# Altium schematic sheet Main.SchDoc
size A2
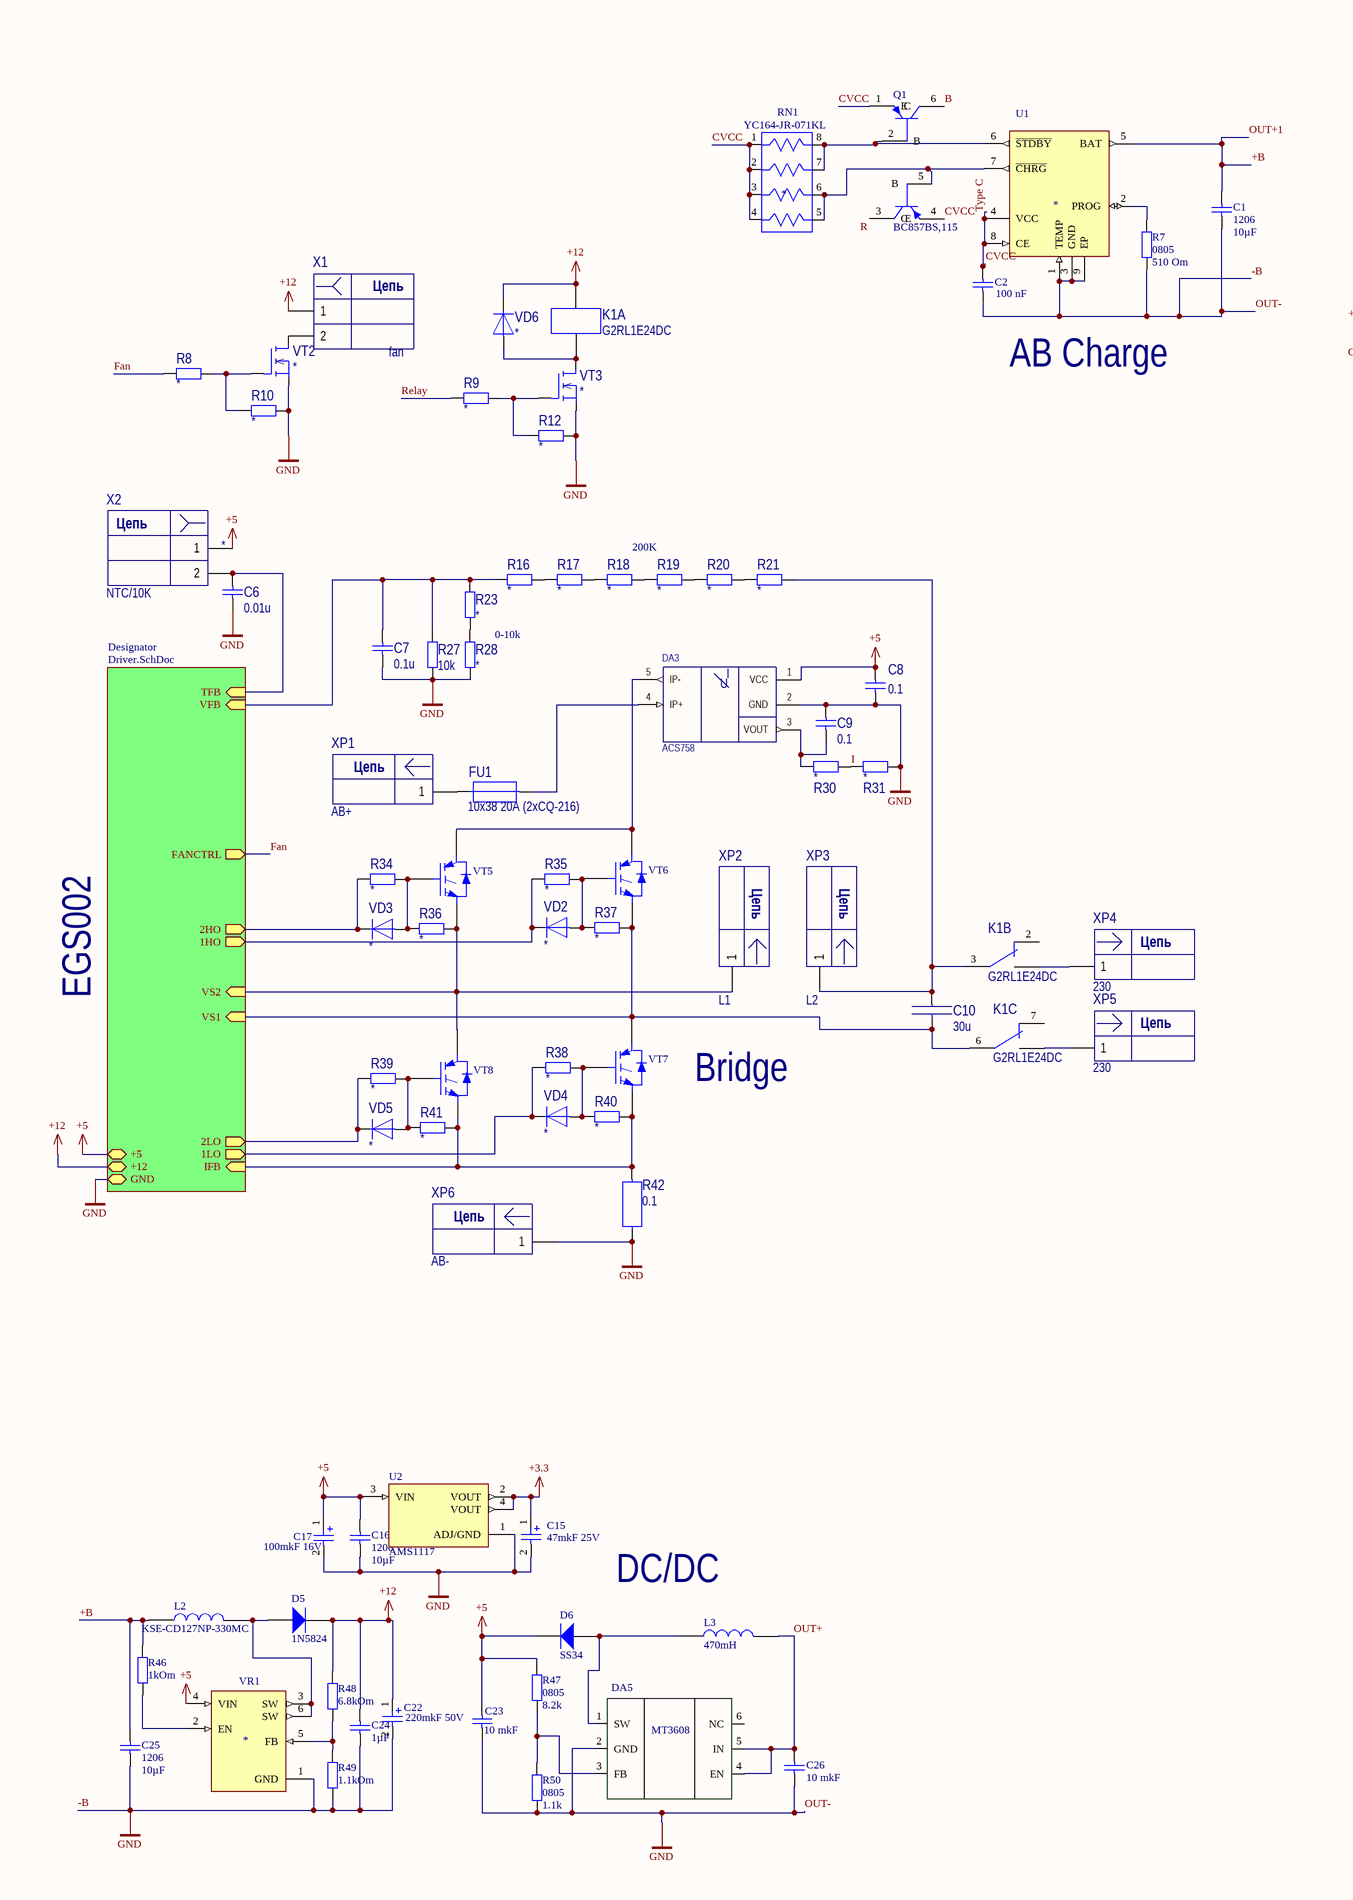
[diagram p0: Main.SchDoc, left]
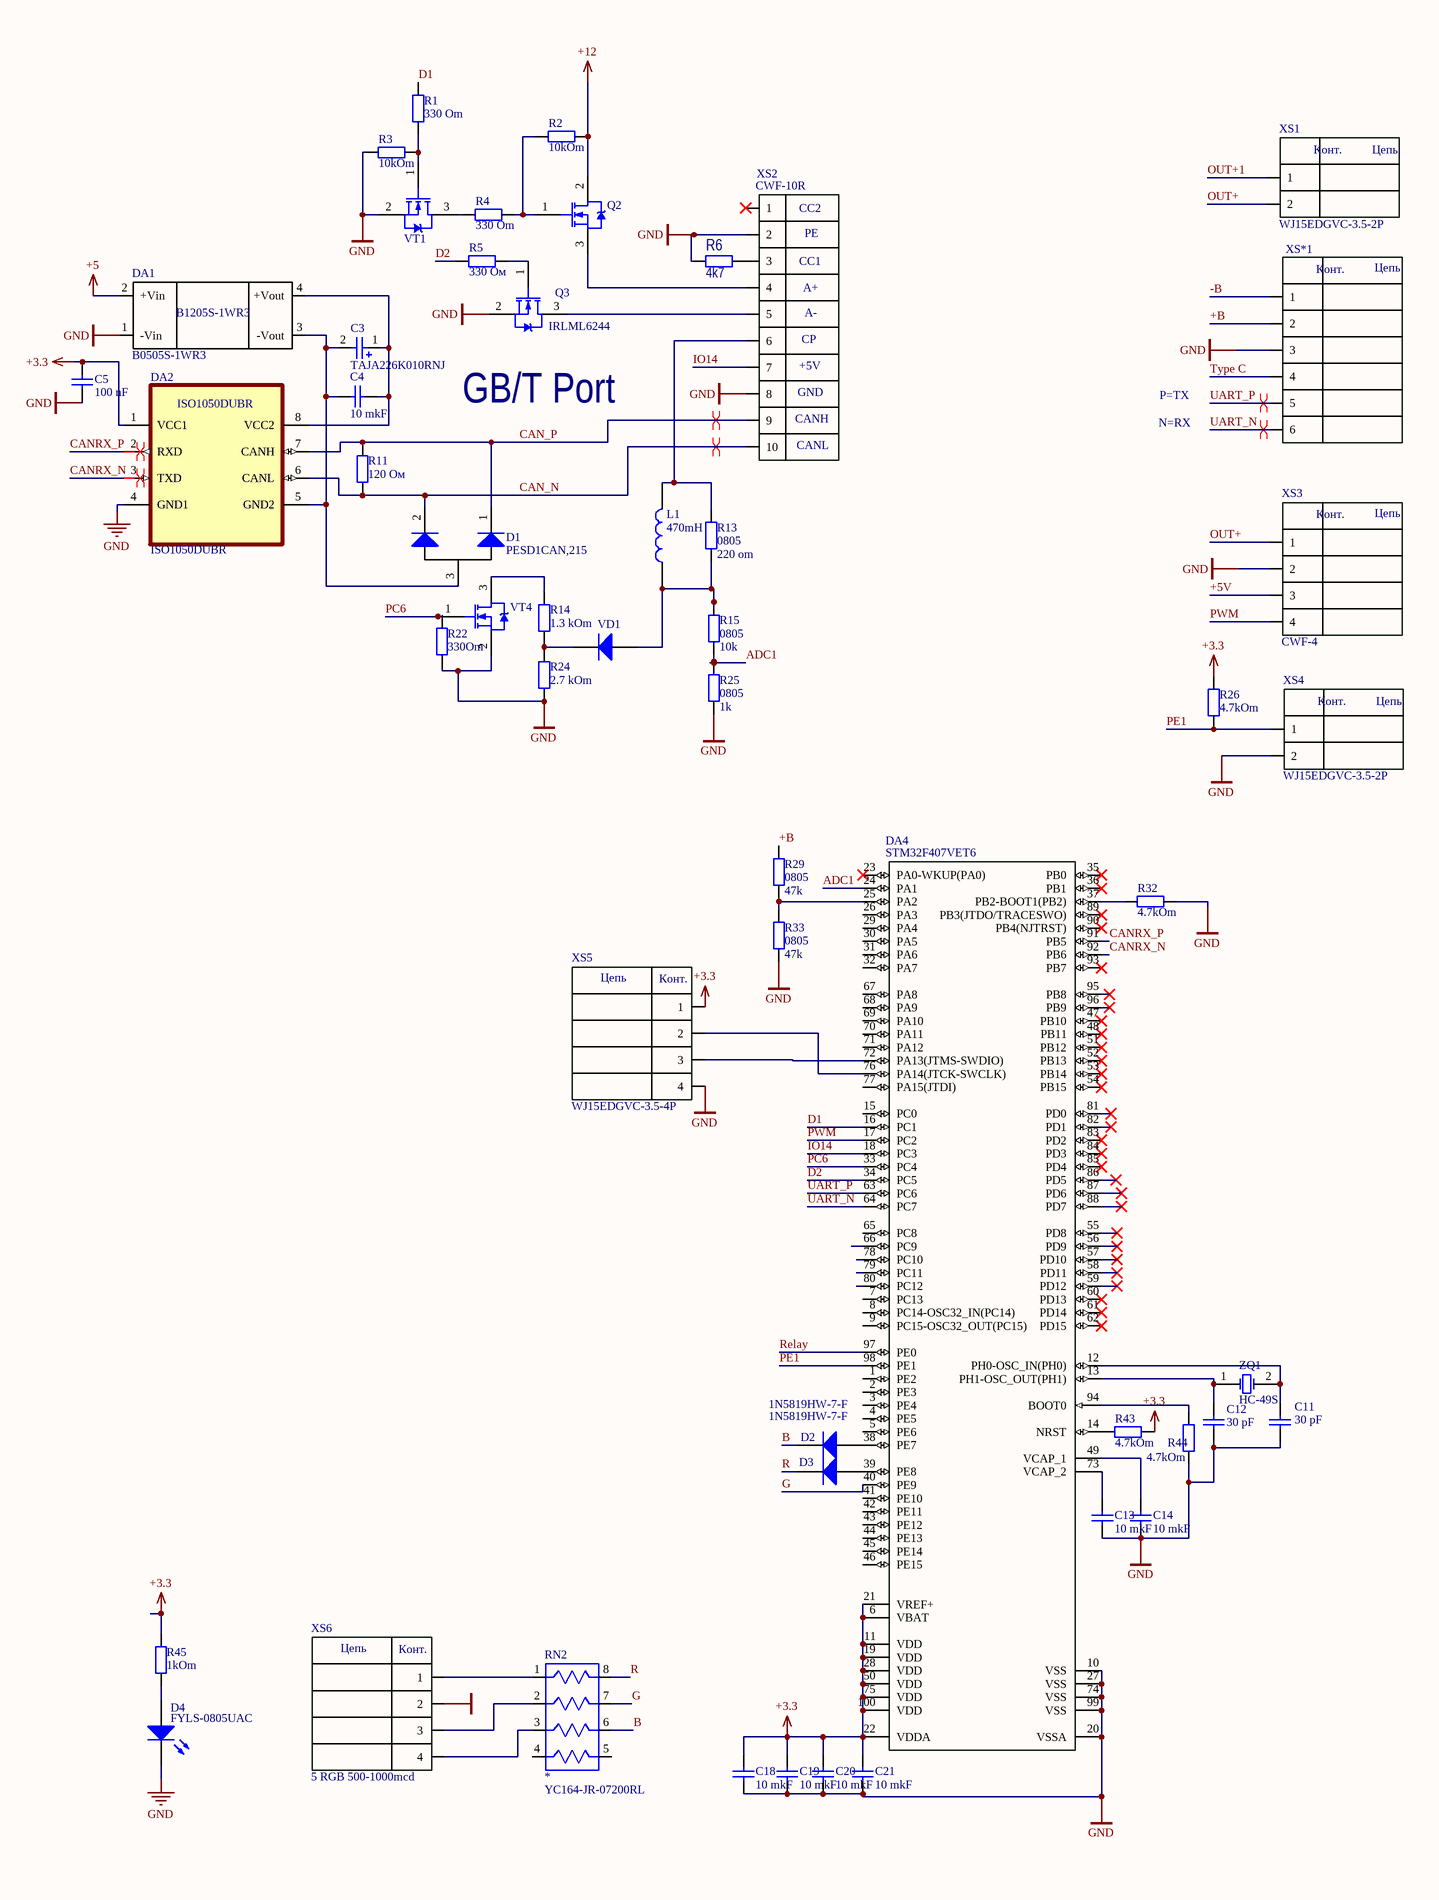
[diagram p1: Main.SchDoc, right]

## Parts
C1  1206  value 10µF  [1206C]
C2  100 nF  [0805_old]
C3  TAJA226K010RNJ  [SMDA Tantal Polar]
C4  10 mkF  [1206C]
C5  100 nF  [6-0805_L]
C6  0.01u  [3216[1206]]
C7  0.1u  [2012[0805]]
C8  0.1  [2012[0805]]
C9  0.1  [2012[0805]]
C10  30u  [B32776G]
C11  30 pF  [0805_old]
C12  30 pF  [0805_old]
C13  10 mkF  [1206C]
C14  10 mkF  [1206C]
C15  47mkF 25V  [SMDD Tantal Polar]
C16  1206  value 10µF  [1206C]
C17  100mkF 16V  [SMDD Tantal Polar]
C18  10 mkF  [1206C]
C19  10 mkF  [1206C]
C20  10 mkF  [1206C]
C21  10 mkF  [1206C]
C22  220mkF 50V  [ECAP 220 35V]
C23  10 mkF  [1206C]
C24  1µF  [1206C]
C25  1206  value 10µF  [1206C]
C26  10 mkF  [1206C]
D1  PESD1CAN,215  [SOT23_M]
D2  1N5819HW-7-F  [1206C Diode]
D3  1N5819HW-7-F  [1206C Diode]
D4  FYLS-0805UAC  [0805_3V3]
D5  1N5824  [*DO214_SS14(Primary) - duplicate]
D6  SS34  [*DO214_SS14(Primary) - duplicate]
DA1  B0505S-1WR3  [SIP4]
DA2  ISO1050DUBR  [ISO1050]
DA3  ACS758  [ACS758]
DA4  STM32F407VET6  [STM-LQFP100_M]
DA5  (no value)  [SOT23-6_L]
FU1  10x38 20A (2xCQ-216)  [Fuse 10x38]
K1  G2RL1E24DC  [G2RL1E24DC]  (parts A,B,C of 3)
L1  470mH  [LQH43CN471K]
L2  value KSE-CD127NP-330MC  [CDRH127/LDNP-680MC]  (hidden comment: AC1050)
L3  470mH  [MT3608 IND]
Q1  BC857BS,115  [SOT95P280X145-6N]
Q2  (no value)  [SOT23_N]
Q3  IRLML6244  [SOT23_N]
R1  330 Om  [6-0805_N]
R2  10kOm  [6-0805_N]
R3  10kOm  [6-0805_N]
R4  330 Om  [6-0805_N]
R5  330 Ом  [6-0805_N]
R6  4k7  [6-0805_L]
R7  0805  value 510 Om  [6-0805_N]
R8  *  [6-0805_L]
R9  *  [6-0805_L]
R10  *  [1005[0402]]
R11  120 Ом  [6-0805_N]
R12  *  [1005[0402]]
R13  0805  value 220 om  [6-0805_N]
R14  value 1.3 kOm  [6-0805_N]  (hidden comment: 0805)
R15  0805  value 10k  [6-0805_N]
R16  *  [3225[1210]]
R17  *  [3225[1210]]
R18  *  [3225[1210]]
R19  *  [3225[1210]]
R20  *  [3225[1210]]
R21  *  [3225[1210]]
R22  value 330Om  [6-0805_N]  (hidden comment: 0805)
R23  *  [3225[1210]]
R24  value 2.7 kOm  [6-0805_N]  (hidden comment: 0805)
R25  0805  value 1k  [6-0805_N]
R26  4.7kOm  [6-0805_N]
R27  10k  [6-0805_N]
R28  *  [3225[1210]]
R29  0805  value 47k  [6-0805_N]
R30  *  [2012[0805]]
R31  *  [2012[0805]]
R32  4.7kOm  [6-0805_N]
R33  0805  value 47k  [6-0805_N]
R34  *  [2012[0805]]
R35  *  [2012[0805]]
R36  *  [2012[0805]]
R37  *  [2012[0805]]
R38  *  [2012[0805]]
R39  *  [2012[0805]]
R40  *  [2012[0805]]
R41  *  [2012[0805]]
R42  0.1  [5W-0.1 draw]
R43  4.7kOm  [6-0805_N]
R44  4.7kOm  [6-0805_N]
R45  1kOm  [6-0805_N]
R46  value 1kOm  [6-0805_N]  (hidden comment: 0805)
R47  0805  value 8.2k  [6-0805_N]
R48  value 6.8kOm  [6-0805_N]  (hidden comment: 0805)
R49  value 1.1kOm  [6-0805_N]  (hidden comment: 0805)
R50  0805  value 1.1k  [6-0805_N]
RN1  *  value YC164-JR-071KL  [RESCAV80P320X160X70-8N]
RN2  *  value YC164-JR-07200RL  [RESCAV80P320X160X70-8N]
U1  *  [SOP127P600X175-9N]
U2  AMS1117  [SOT229P700X180-4N]
VD1  SK-24  [SMDA diode]  (value not drawn)
VD2  *  [SMDA diode]
VD3  *  [SMDA diode]
VD4  *  [SMDA diode]
VD5  *  [SMDA diode]
VD6  *  [SMDA diode]
VR1  *  [xl6009]
VT1  IRLM0040  [SOT23_N]  (value not drawn)
VT2  *  [DPAK229P990X239-3N]
VT3  *  [DPAK229P990X239-3N]
VT4  IRLM0040  [SOT23_N]  (value not drawn)
VT5  VT Transistor IGBT  [to247-hor]  (value not drawn)
VT6  VT Transistor IGBT  [to247-hor]  (value not drawn)
VT7  VT Transistor IGBT  [to247-hor]  (value not drawn)
VT8  VT Transistor IGBT  [to247-hor]  (value not drawn)
X1  fan  [CWF-2]
X2  NTC/10K  [CWF-2]
XP1  AB+  [K13 М4*9(DECA SwitchLab)]
XP2  L1  [K13 М4*9(DECA SwitchLab)]
XP3  L2  [K13 М4*9(DECA SwitchLab)]
XP4  230  [K13 М4*9(DECA SwitchLab)]
XP5  230  [K13 М4*9(DECA SwitchLab)]
XP6  AB-  [K13 М4*9(DECA SwitchLab)]
XS1  WJ15EDGVC-3.5-2P  [CWF-2]
XS2  CWF-10R  [CWF-10]
XS3  CWF-4  [CWF-4]
XS4  WJ15EDGVC-3.5-2P  [CWF-2]
XS5  WJ15EDGVC-3.5-4P  [PLS-4 - duplicate]
XS6  5 RGB 500-1000mcd  [5 RGB 500-1000mcd]
XS*1  *  [CWF-6]  (value not drawn)
ZQ1  HC-49S  [HC 49SM]

## Sub-sheets
Designator = Driver.SchDoc: IFB (in), 1LO (out), VS1 (in), 1HO (out), 2LO (out), GND, +12, +5, VS2 (in), 2HO (out), VFB (in), TFB (in), FANCTRL (out)

## Nets
+3.3: C5.1 C15.1 C18.1 C19.1 C20.1 C21.1 DA2.1(VCC1) DA4.6(VBAT) DA4.11(VDD) DA4.19(VDD) DA4.21(VREF+) DA4.22(VDDA) DA4.28(VDD) DA4.50(VDD) DA4.75(VDD) DA4.100(VDD) R26.2 R43.1 R45.2 U2.2(VOUT) U2.4(VOUT) XS5.1
+5: C8.1 C16.1 C17.1 C23.1 D6.2(K) DA1.2(+Vin) DA3.1(VCC) R47.2 U2.3(VIN) VR1.4(VIN) X2.1 ; sheet Designator/+5
+12: C22.1 C24.2 D5.2(K) K1.1 Q2.2(D) R2.2 R48.2 VD6.2(K) X1.1 ; sheet Designator/+12
-B: C1.2 C2.1 C5.2 C6.2 C7.2 C8.2 C9.1 C11.2 C12.2 C13.2 C14.2 C15.2 C16.2 C17.2 C18.2 C19.2 C20.2 C21.2 C22.2 C23.2 C24.1 C25.2 C26.2 D4.2(K) DA1.1(-Vin) DA2.4(GND1) DA3.2(GND) DA4.10(VSS) DA4.20(VSSA) DA4.27(VSS) DA4.74(VSS) DA4.99(VSS) DA5.2(GND) Q3.2(S) R3.1 R6.1 R7.1 R10.2 R12.2 R22.1 R24.1 R25.1 R27.1 R28.1 R31.1 R32.1 R33.1 R42.1 R44.1 R49.1 R50.1 U1.1(TEMP) U1.3(GND) U1.9(EP) U2.1(ADJ/GND) VR1.1(GND) VT1.2(S) VT2.3(S) VT3.3(S) VT4.2(S) XP6.1 XS2.2 XS2.8 XS3.2 XS4.2 XS5.4 XS6.2 XS*1.1 XS*1.3 ; sheet Designator/GND  [also labelled GND, OUT-]
+5V: XS3.3
+B: C1.1 C25.1 L2.1 R29.2 R46.2 U1.5(BAT) XS1.1 XS*1.2  [also labelled OUT+1]
ADC1: DA4.24(PA1) R15.1 R25.2
B: D2.2(K) Q1.6(C) RN2.6
CAN_N: D1.2(K) DA2.6(CANL) R11.1 XS2.10
CAN_P: D1.1(K) DA2.7(CANH) R11.2 XS2.9
CANRX_N: DA2.3(TXD) DA4.92(PB6)
CANRX_P: DA2.2(RXD) DA4.91(PB5)
CVCC: C2.2 Q1.1(E) Q1.4(E) RN1.1 RN1.2 RN1.3 RN1.4 U1.4(VCC) U1.8(CE) XS*1.4  [also labelled Type C]
D1: DA4.16(PC1) R1.2
D2: DA4.34(PC5) R5.1
Fan: R8.1 ; sheet Designator/FANCTRL
G: DA4.40(PE9) RN2.7
I: R30.1 R31.2
IO14: DA4.18(PC3) XS2.7
OUT+: C26.1 DA5.4(EN) DA5.5(IN) L3.2 XS1.2 XS3.1
PC6: DA4.33(PC4) R22.2 VT4.1(G)
PE1: DA4.98(PE1) R26.1 XS4.1
PWM: DA4.17(PC2) XS3.4
R: D3.2(K) Q1.3(C) RN2.8
Relay: DA4.97(PE0) R9.1
UART_N: DA4.64(PC7) XS*1.6
UART_P: DA4.63(PC6) XS*1.5
NetC3_1: C3.1 C4.1 DA1.4(+Vout) DA2.8(VCC2)
NetC3_2: C3.2 C4.2 D1.3(A) DA1.3(-Vout) DA2.5(GND2)
NetC6_1: C6.1 X2.2 ; sheet Designator/TFB
NetC7_1: C7.1 R16.2 R23.1 R27.2 ; sheet Designator/VFB
NetC9_2: C9.2 DA3.3(VOUT) R30.2
NetC10_1: C10.1 K1.3 R21.1 XP3.1
NetC10_2: C10.2 K1.6 R37.2 VT6.3(E) VT7.2(C) ; sheet Designator/VS1
NetC11_1: C11.1 DA4.12(PH0-OSC_IN(PH0)) ZQ1.2(OSC2)
NetC12_1: C12.1 DA4.13(PH1-OSC_OUT(PH1)) ZQ1.1(OSC1)
NetC13_1: C13.1 DA4.73(VCAP_2)
NetC14_1: C14.1 DA4.49(VCAP_1)
NetD2_1: D2.1(A) DA4.38(PE7)
NetD3_1: D3.1(A) DA4.39(PE8)
NetD4_1: D4.1(A) R45.1
NetD5_1: D5.1(A) L2.2 VR1.3(SW) VR1.6(SW)
NetD6_1: D6.1(A) DA5.1(SW) L3.1
NetDA3_4: DA3.4(IP+) FU1.2
NetDA3_5: DA3.5(IP-) VT5.2(C) VT6.2(C)
NetDA4_14: DA4.14(NRST) R43.2
NetDA4_25: DA4.25(PA2) R29.1 R33.2
NetDA4_37: DA4.37(PB2-BOOT1(PB2)) R32.2
NetDA4_72: DA4.72(PA13(JTMS-SWDIO)) XS5.3
NetDA4_76: DA4.76(PA14(JTCK-SWCLK)) XS5.2
NetDA4_94: DA4.94(BOOT0) R44.2
NetDA5_3: DA5.3(FB) R47.1 R50.2
NetFU1_1: FU1.1 XP1.1
NetK1_4: K1.4 XP4.1
NetK1_5: K1.5 XP5.1
NetK1_8: K1.8 VD6.1(A) VT3.2(D)
NetL1_1: L1.1 R13.1 R15.2 VD1.1(A)
NetL1_2: L1.2 R13.2 XS2.6
NetQ1_2: Q1.2(B) RN1.7 RN1.8 U1.6(~{STDBY})
NetQ1_5: Q1.5(B) RN1.5 RN1.6 U1.7(~{CHRG})
NetQ2_1: Q2.1(G) R2.1 R4.1
NetQ2_3: Q2.3(S) XS2.4
NetQ3_1: Q3.1(G) R5.2
NetQ3_3: Q3.3(D) XS2.5
NetR1_1: R1.1 R3.2 VT1.1(G)
NetR4_2: R4.2 VT1.3(D)
NetR6_2: R6.2 XS2.3
NetR7_2: R7.2 U1.2(PROG)
NetR8_2: R8.2 R10.1 VT2.1(G)
NetR9_2: R9.2 R12.1 VT3.1(G)
NetR14_1: R14.1 R24.2 VD1.2(K)
NetR14_2: R14.2 VT4.3(D)
NetR16_1: R16.1 R17.2
NetR17_1: R17.1 R18.2
NetR18_1: R18.1 R19.2
NetR19_1: R19.1 R20.2
NetR20_1: R20.1 R21.2
NetR23_2: R23.2 R28.2
NetR34_1: R34.1 VD3.2(K) ; sheet Designator/2HO
NetR34_2: R34.2 R36.1 VD3.1(A) VT5.1(G)
NetR35_1: R35.1 VD2.2(K) ; sheet Designator/1HO
NetR35_2: R35.2 R37.1 VD2.1(A) VT6.1(G)
NetR36_2: R36.2 VT5.3(E) VT8.2(C) XP2.1 ; sheet Designator/VS2
NetR38_1: R38.1 VD4.2(K) ; sheet Designator/1LO
NetR38_2: R38.2 R40.1 VD4.1(A) VT7.1(G)
NetR39_1: R39.1 VD5.2(K) ; sheet Designator/2LO
NetR39_2: R39.2 R41.1 VD5.1(A) VT8.1(G)
NetR40_2: R40.2 R41.2 R42.2 VT7.3(E) VT8.3(E) ; sheet Designator/IFB
NetR46_1: R46.1 VR1.2(EN)
NetR48_1: R48.1 R49.2 VR1.5(FB)
NetRN2_1: RN2.1 XS6.1
NetRN2_2: RN2.2 XS6.3
NetRN2_3: RN2.3 XS6.4
NetVT2_2: VT2.2(D) X1.2

Not connected (* = marked no-connect by the designer): DA4 1(PE2) 2(PE3) 3(PE4) 4(PE5) 5(PE6) 7(PC13) 8(PC14-OSC32_IN(PC14)) 9(PC15-OSC32_OUT(PC15)) 15(PC0) 23(PA0-WKUP(PA0))* 26(PA3) 29(PA4) 30(PA5) 31(PA6) 32(PA7) 35(PB0)* 36(PB1)* 41(PE10) 42(PE11) 43(PE12) 44(PE13) 45(PE14) 46(PE15) 47(PB10)* 48(PB11)* 51(PB12)* 52(PB13)* 53(PB14)* 54(PB15)* 55(PD8)* 56(PD9)* 57(PD10)* 58(PD11)* 59(PD12)* 60(PD13)* 61(PD14)* 62(PD15)* 65(PC8) 66(PC9) 67(PA8) 68(PA9) 69(PA10) 70(PA11) 71(PA12) 77(PA15(JTDI)) 78(PC10) 79(PC11) 80(PC12) 81(PD0)* 82(PD1)* 83(PD2)* 84(PD3)* 85(PD4)* 86(PD5)* 87(PD6)* 88(PD7)* 89(PB3(JTDO/TRACESWO))* 90(PB4(NJTRST))* 93(PB7)* 95(PB8)* 96(PB9)*; DA5 6(NC); K1 2 7; RN2 4 5; XS2 1*

## Layout directives
differential pair: CAN_N, CAN_P, CANRX_N, CANRX_P, UART_N, UART_P

## Notes on the sheet
- (near XS2) CC2
- (near XS2) PE
- (near XS2) CC1
- (near XS2) A+
- (near XS2) A-
- (near XS2) +5V
- (near XS2) CP
- AB Charge
- (near Q3) GB/T Port
- (near XS2) CANH
- (near XS2) CANL
- (near XS2) GND
- N=RX
- P=TX
- 200K
- 0-10k
- EGS002
- Bridge
- DC/DC
- (in symbol ACS758LCB-050B) I; U
- (in symbol PLS-2) Конт.; Цепь
- (in symbol PLS-4_1) Цепь; Конт.
- (in symbol PLS-6) Цепь; Конт.
- (in symbol XP-PBS-2) Цепь
- (in symbol XP-PLS-1) Цепь

## Library data of the parts
C1 C16 C24 C25 = Cap: Capacitor; Published: 8-Jun-2000; LatestRevisionDate: 17-Jul-2002; LatestRevisionNote: Re-released for DXP Platform.; PackageReference: RAD-0.3; Publisher: Altium Limited; PackageDescription: Radial Cap, Thru-Hole; 2 Leads; 0.3 in Pin Spacing
  C24: Value: 1µF
C2 C5 = Cap: 50V 100nF X7R ±10% 0805 Multilayer Ceramic Capacitors MLCC - SMD/SMT ROHS; Manufacturer: YAGEO; MFPN: CC0805KRX7R9BB104; LCPN: C49678; Type: Capacitors; Symbol: Capacitor; URL: https://www.lcsc.com/product-detail/Multilayer-Ceramic-Capacitors-MLCC-SMD-SMT_YAGEO-CC0805KRX7R9BB104_C49678.html; Value: 100 nF; Supplier: LC; ID: *; Footprint Type: SMD; Footprint: 0805
C3 = Cap Pol2: Manufacturer: AVX; Type: Capacitors; Symbol: Capacitor; Value: TAJA226K010RNJ; Supplier: LC; MFPN: TAJA226K010RNJ; Footprint Type: SMD
C4 C13 C14 C18-C21 C23 C26 = Cap: 50V 10uF X5R ±10% 1206 Multilayer Ceramic Capacitors MLCC - SMD/SMT ROHS; Manufacturer: YAGEO; MFPN: CC1206KKX5R9BB106; LCPN: C100122; Type: Capacitors; Symbol: Capacitor; URL: https://www.lcsc.com/product-detail/Multilayer-Ceramic-Capacitors-MLCC-SMD-SMT_YAGEO-CC1206KKX5R9BB106_C100122.html; Value: 10 mkF; Supplier: LC; ID: *; Footprint Type: SMD; Footprint: 1206
C6 C7 = C-4del: Конденсатор; Manufacturer: Murata; ManufacturerPartNumber: GRM21B X7R 104 50V; Power/Voltage: 50В; Value: 0.1; Tolerance: 10%; TKE/TKC: X7R; Specification: K; BCPId: *; Rem: *; Package: *; Type: Конденсатор; TU/GOST: *; Name: *; HelpURL: *; Price: *
C8 C9 = C-4del: Конденсатор; Manufacturer: Murata; ManufacturerPartNumber: GRM21B X7R 104 50V; Power/Voltage: 50В; Tolerance: 10%; TKE/TKC: X7R; Specification: K; BCPId: *; Rem: *; Package: *; Value: 0.1; Type: Конденсатор; TU/GOST: *; Name: *; HelpURL: *; Price: *
C10 = C nonpol: Конденсатор; Manufacturer: Murata; ManufacturerPartNumber: GRM21_R71H104; Power/Voltage: 50В; Value: 0.1м; Tolerance: 10%; TKE/TKC: X7R; Specification: K; BCPId: *; Rem: *; Package: *; Type: Конденсатор; TU/GOST: *; Name: *; HelpURL: *; Price: *
C11 C12 = Cap: 50V 30pF NP0 ±5% 0805 Multilayer Ceramic Capacitors MLCC - SMD/SMT ROHS; Manufacturer: YAGEO; MFPN: CC0805JRNPO9BN300; LCPN: C107114; Type: Capacitors; Symbol: Capacitor; URL: https://www.lcsc.com/product-detail/Multilayer-Ceramic-Capacitors-MLCC-SMD-SMT_YAGEO-CC0805JRNPO9BN300_C107114.html; Value: 30 pF; Supplier: LC; ID: *; Footprint Type: SMD; Footprint: 0805
C15 = Cap Pol2: 47uF 25V 700mΩ ±10% 2917 Tantalum Capacitors ROHS; Manufacturer: Vishay Intertech; MFPN: 293D476X9025D2TE3; LCPN: C1953049; Type: Tantalum Capacitors; Symbol: Tantalum Capacitor; URL: https://www.lcsc.com/product-detail/Tantalum-Capacitors_Vishay-Intertech-293D476X9025D2TE3_C1953049.html; Value: 47mkF 25V; Supplier: LC; ID: *; Footprint Type: SMDD; Footprint: SMDD Tantal
C17 C22 = Cap Pol2: 220uF 50V 220mA@120Hz ±20% SMD,10x10.5mm Aluminum Electrolytic Capacitors - SMD ROHS; Manufacturer: KNSCHA; MFPN: 126RV0004; LCPN: C5354991; Type: Aluminum Electrolytic Capacitors; Symbol: Capacitor; URL: https://www.lcsc.com/product-detail/Aluminum-Electrolytic-Capacitors-SMD_KNSCHA-126RV0004_C5354991.html; Supplier: LC; ID: *; Footprint Type: SMD; Footprint: ECAP 220 50V
  C17: Value: 100mkF 16V
  C22: Value: 220mkF 50V
D1 = Diode: 25.4V 70V Bi-Directional 24V SOT-23(TO-236) ESD Protection Devices ROHS; pin to pad: 1>3 3>1; Manufacturer: Nexperia; LCPN: C15771; URL: https://www.lcsc.com/product-detail/span-style-background-color-ff0-ESD-span-Protection-Devices_Nexperia-PESD1CAN-215_C15771.html; Type: Protection Devices; Symbol: Protection Device; Value: PESD1CAN,215; Supplier: LC; MFPN: PESD1CAN,215; Footprint Type: SMD; Footprint: SOT23_L
D2 D3 = Diode: 40V 450mV@1A 1A SOD-123 Schottky Barrier Diodes (SBD) ROHS; Manufacturer: Diodes Incorporated; LCPN: C82544; URL: https://www.lcsc.com/product-detail/Schottky-Barrier-Diodes-SBD_Diodes-Incorporated-1N5819HW-7-F_C82544.html; MFPN: 1N5819HW-7-F; Type: Schottky Barrier Diodes; Symbol: Schottky Barrier Diode; Value: 1N5819HW-7-F; Supplier: LC; Footprint Type: SMD; Footprint: SOD-123
D4 = LED2: Colorless transparence -40℃~+85℃ 598nm~608nm Orange 120° 40mW 0805 Light Emitting Diodes (LED) ROHS; Manufacturer: Yongyu Photoelectric; LCPN: C434437; MFPN: FYLS-0805UAC; Supplier: LC; URL: https://www.lcsc.com/product-detail/Light-Emitting-Diodes-LED_Yongyu-Photoelectric-SZYY0805O_C434437.html; Type: LED; Value: FYLS-0805UAC; Symbol: LED; Footprint Type: SMD; Footprint: 0805
D5 D6 = Diode: SMB(DO-214AA) Schottky Barrier Diodes (SBD) ROHS; Manufacturer: TWGMC; MFPN: SS24; LCPN: C5204947; URL: https://www.lcsc.com/product-detail/Schottky-Barrier-Diodes-SBD_TWGMC-SS24_C5204947.html; Type: Schottky Barrier Diodes; Symbol: Schottky Barrier Diode; Supplier: LC; Footprint Type: SMB; Footprint: DO-214AA
  D5: Value: 1N5824
  D6: Value: SS34
DA1 = B1205S-1WR3: 5V 200mA 10.8V~13.2V 1W 80% Plugin Power Modules ROHS; Manufacturer: MORNSUN Guangzhou S& T; LCPN: C970821; Value: B0505S-1WR3; URL: https://www.lcsc.com/product-detail/Power-Modules_MORNSUN-Guangzhou-S-T-B1205S-1WR3_C970821.html; Type: Power Modules; Symbol: Power Module; Supplier: LC; MFPN: B1205S-1WR3; Footprint Type: DIP; Footprint: AM1S-1212SZ
DA2 = ISO1050DUBR: 1Mbps SOP-8 CAN ICs ROHS; Manufacturer: Texas Instruments; Symbol: CAN IC; LCPN: C16428; Supplier: LC; MFPN: ISO1050DUBR; Footprint Type: SMD; URL: https://www.lcsc.com/product-detail/CAN-ICs_Texas-Instruments-ISO1050DUBR_C16428.html; Value: ISO1050DUBR; Type: CAN ICs
DA3 = ACS758LCB-050B: DC датчик тока
DA4 = STM32F407VGT7: 512KB 1.8V~3.6V ARM Cortex-M4 192KB 168MHz FLASH 82 LQFP-100(14x14) Microcontroller Units (MCUs/MPUs/SOCs) ROHS; Manufacturer: STMicroelectronics; LCPN: C28730; Footprint Type: SMD; MFPN: STM32F407VET6; Supplier: LC; Symbol: Microcontroller; Type: Microcontrollers; URL: https://www.lcsc.com/product-detail/Microcontroller-Units-MCUs-MPUs-SOCs_STMicroelectronics-STM32F407VET6_C28730.html; Value: STM32F407VET6
DA5 = MT3608
FU1 = FU: Вставка плавкая; ManufacturerPartNumber: ВП1-2; Power/Voltage: 0.25 А, 250 В; TU/GOST: ОЮ0.480.003ТУ-Р; Specification: K; BCPId: *; Tolerance: *; Rem: *; Package: *; Value: *; Type: Вставка плавкая; Name: *; TKE/TKC: *; HelpURL: *; Price: *
K1 = K Rele DPDT: Реле; Specification: K; BCPId: *; Manufacturer: *; Rem: *; Package: *; ManufacturerPartNumber: *; Type: Лампа вакуумная; TU/GOST: *; HelpURL: *; Price: *
L1 = Inductor Iron: 120mA 470uH ±10% 10.4Ω 1812 Inductors (SMD) ROHS; Manufacturer: FH (Guangdong Fenghua Advanced Tech); MFPN: FHW1812IF471KST; LCPN: C394141; Type: Inductors; Symbol: Inductor; URL: https://www.lcsc.com/product-detail/Inductors-SMD_FH-Guangdong-Fenghua-Advanced-Tech-FHW1812IF471KST_C394141.html; Value: 470mH; Supplier: LC; ID: *; Footprint Type: SMD
L2 = Inductor Iron: Magnetic-Core Inductor; Published: 24-Mar-1999; LatestRevisionDate: 17-Jul-2002; LatestRevisionNote: Re-released for DXP Platform.; PackageReference: AXIAL-0.9; Publisher: Altium Limited; PackageDescription: Axial Device, Thru-Hole; 2 Leads; 0.9 in Pin Spacing
L3 = Inductor Iron: 120mA 470uH ±10% 10.4Ω 1812 Inductors (SMD) ROHS; Manufacturer: FH (Guangdong Fenghua Advanced Tech); MFPN: B82472G6223M000; LCPN: C394141; Type: Inductors; Symbol: Inductor; URL: https://www.lcsc.com/product-detail/Inductors-SMD_FH-Guangdong-Fenghua-Advanced-Tech-FHW1812IF471KST_C394141.html; Value: 470mH; Supplier: LC; ID: *; Footprint Type: SMD; Footprint: LQH43CN471K
Q1 = BC857BS,115: NPN Bipolar Transistor; Published: 8-Jun-2000; LatestRevisionDate: 17-Jul-2002; LatestRevisionNote: Re-released for DXP Platform.; PackageReference: TO-226-AA; Publisher: Altium Limited; PackageDescription: TO, Flat Index; 3 In-Line, Axial Leads; Body Dia. 4.8mm; Leads 0.55 x 0.51 mm (max); Code_JEDEC: TO-226-AA
Q2 = NMOS-2_1: N-Channel Power MOSFET; Note: Pin 2 is electrically connected to pin 4.; Published: 8-Jun-2000; LatestRevisionDate: 17-Jul-2002; LatestRevisionNote: Re-released for DXP Platform.; DatasheetVersion: PD-9.814; PackageVersion: Feb-1997; PackageReference: TO-220AB; Publisher: Altium Limited; PackageDescription: TO, Thru-Hole, Vertical, Heatsink Mounted; 3 In-Line Leads; Pitch 2.54 mm; ComponentLink1Description: Manufacturer Link; ComponentLink1URL: http://www.irf.com/
Q3 = NMOS-2: N-Channel Power MOSFET; Manufacturer: Guangdong Hottech; LCPN: C5364311; Type: MOSFETs; URL: https://www.lcsc.com/product-detail/MOSFETs_Guangdong-Hottech-IRLML6244_C5364311.html; Symbol: MOSFET; Value: IRLML6244; Supplier: LC; MFPN: IRLML6244; Footprint Type: SMD
R1 R4 = Res2: 125mW Thick Film Resistors ±100ppm/℃ ±1% 2.49kΩ 0805 Chip Resistor - Surface Mount ROHS; Manufacturer: YAGEO; LCPN: C185290; MFPN: RC0805FR-072K49L; Value: 330 Om; URL: https://www.lcsc.com/product-detail/Chip-Resistor-Surface-Mount_YAGEO-RC0805FR-072K49L_C185290.html; Symbol: Resistor; Supplier: LC; Footprint Type: SMD; Type: Resistors; Footprint: 0805
R2 R3 = Res2: 125mW Thick Film Resistors ±100ppm/℃ ±5% 10kΩ 0805 Chip Resistor - Surface Mount ROHS; Manufacturer: YAGEO; LCPN: C100047; MFPN: RC0805JR-0710KL; Value: 10kOm; URL: https://www.lcsc.com/product-detail/Chip-Resistor-Surface-Mount_YAGEO-RC0805JR-0710KL_C100047.html; Symbol: Resistor; Supplier: LC; Footprint Type: SMD; Type: Resistors; Footprint: 0805
R5 R11 = Res2: 125mW Thick Film Resistors ±100ppm/℃ ±1% 120Ω 0805 Chip Resistor - Surface Mount ROHS; Manufacturer: YAGEO; LCPN: C114245; MFPN: RC0805FR-07120RL; URL: https://www.lcsc.com/product-detail/Chip-Resistor-Surface-Mount_YAGEO-RC0805FR-07120RL_C114245.html; Symbol: Resistor; Supplier: LC; Footprint Type: SMD; Type: Resistors; Footprint: 0805
  R5: Value: 330 Ом
  R11: Value: 120 Ом
R6 R8-R10 R12 R16-R21 R23 R27 R28 R30 R31 R34-R41 = R-4del: Резистор; Manufacturer: Yageo; ManufacturerPartNumber: RC0805JR-07120R; Power/Voltage: 0.125Вт; Tolerance: 5%; Specification: K; BCPId: *; Rem: *; Package: *; Value: *; TU/GOST: *; Type: Резистор; Name: *; TKE/TKC: *; HelpURL: *; Price: *
R7 R13-R15 R22 R24 R25 R29 R33 R46-R50 = Res2: Resistor; Published: 8-Jun-2000; LatestRevisionDate: 17-Jul-2002; LatestRevisionNote: Re-released for DXP Platform.; PackageReference: AXIAL-0.4; Publisher: Altium Limited; PackageDescription: Axial Device, Thru-Hole; 2 Leads; 0.4 in Pin Spacing
R26 R32 R43 R44 = Res2: 125mW Thick Film Resistors ±100ppm/℃ ±5% 4.7kΩ 0805 Chip Resistor - Surface Mount ROHS; Manufacturer: YAGEO; LCPN: C105427; MFPN: RC0805JR-074K7L; Value: 4.7kOm; URL: https://www.lcsc.com/product-detail/Chip-Resistor-Surface-Mount_YAGEO-RC0805JR-074K7L_C105427.html; Symbol: Resistor; Supplier: LC; Footprint Type: SMD; Type: Resistors; Footprint: 0805
R42 = R: Резистор; Manufacturer: Yageo; ManufacturerPartNumber: RC0805JR-07120R; Power/Voltage: 0.125Вт; Tolerance: 5%; Specification: K; BCPId: *; Rem: *; Package: *; Value: *; TU/GOST: *; Type: Резистор; Name: *; TKE/TKC: *; HelpURL: *; Price: *
R45 = Res2: 125mW Thick Film Resistors ±100ppm/℃ ±5% 1kΩ 0805 Chip Resistor - Surface Mount ROHS; Manufacturer: YAGEO; LCPN: C100046; MFPN: RC0805JR-071KL; Value: 1kOm; URL: https://www.lcsc.com/product-detail/Chip-Resistor-Surface-Mount_YAGEO-RC0805JR-071KL_C100046.html; Symbol: Resistor; Supplier: LC; Footprint Type: SMD; Type: Resistors; Footprint: 0805
RN1 RN2 = YC124-JR-071KL: 1k Ohm Â±5% 62.5mW Power Per Element Isolated Resistor Network/Array Â±200ppm/Â°C 0804, Convex, Long Side Terminals; MF: Yageo; SnapEDA_Link: https://www.snapeda.com/parts/YC124-JR-071KL/Yageo/view-part/496240/?ref=snap; Arrow_Electronics-Purchase-URL: https://snapeda.com/shop?store=Arrow+Electronics&id=496240; MP: YC124-JR-071KL; Availability: Good; Package: 0804 Yageo; DigiKey-Purchase-URL: https://snapeda.com/shop?store=DigiKey&id=496240; Price: None; Mouser-Purchase-URL: https://snapeda.com/shop?store=Mouser&id=496240
U1 = TP4056: Complete single cell Li-Ion battery with a constant current / constant voltage linear charger; MF: NanJing Top Power ASIC Corp.; Check_prices: https://www.snapeda.com/parts/TP4056/NanJing+Top+Power+ASIC+Corp./view-part/?ref=eda; SnapEDA_Link: https://www.snapeda.com/parts/TP4056/NanJing+Top+Power+ASIC+Corp./view-part/?ref=snap; Price: None; Availability: Not in stock; Package: Package; MP: TP4056; Value: *
U2 = AMS1117: Sot223/Pkg 1-Amp 5-Volt Low Drop Out Voltage Regulatator; Value: *; Availability: Unavailable; Price: None; MP: AMS1117; Package: None
VD1 = Diode: Default Diode; Published: 8-Jun-2000; LatestRevisionDate: 17-Jul-2002; LatestRevisionNote: Re-released for DXP Platform.; PackageVersion: Sep-1996; PackageReference: SMC; Publisher: Altium Limited; PackageDescription: DO-214-AB/SMC; 2 C-Bend Leads; Body 7.9 x 5.9 mm, inc. leads (LxW); Code_JEDEC: DO-214-AB
VD2-VD6 = VD Diod: Диод; Specification: K; BCPId: *; Manufacturer: *; Rem: *; Package: *; ManufacturerPartNumber: *; Type: Диод; TU/GOST: *; HelpURL: *; Price: *
VR1 = XL6009: The XL6009 regulator is a wide input range, current mode, DC/DC converter which is capable of generating either positive or negative output voltages.; MF: XLSEMI; Package: TO-263-5L XLSEMI; Price: None; Value: *; SnapEDA_Link: https://www.snapeda.com/parts/XL6009/XLSEMI/view-part/?ref=snap; MP: XL6009; Availability: Not in stock; Check_prices: https://www.snapeda.com/parts/XL6009/XLSEMI/view-part/?ref=eda
VT1 VT4 = NMOS-2: N-Channel Power MOSFET; Note: Pin 2 is electrically connected to pin 4.; Published: 8-Jun-2000; LatestRevisionDate: 17-Jul-2002; LatestRevisionNote: Re-released for DXP Platform.; DatasheetVersion: PD-9.814; PackageVersion: Feb-1997; PackageReference: TO-220AB; Publisher: Altium Limited; PackageDescription: TO, Thru-Hole, Vertical, Heatsink Mounted; 3 In-Line Leads; Pitch 2.54 mm; ComponentLink1Description: Manufacturer Link; ComponentLink1URL: http://www.irf.com/
VT2 VT3 = VT Transistor NMOS: Транзистор полевой n-канальный; Specification: K; BCPId: *; Manufacturer: *; Rem: *; Package: *; ManufacturerPartNumber: *; Type: Транзистор; TU/GOST: *; HelpURL: *; Price: *
VT5-VT8 = VT Transistor IGBT: Транзистор IGBT
X1 X2 = XP-PBS-2: Гнездо 2-контакта; ManufacturerPartNumber: PBS-2-2.54; Specification: K; BCPId: *; Manufacturer: *; Rem: *; Package: *; TU/GOST: *; Type: Розетка; HelpURL: *; Price: *
XP1-XP6 = XP-PLS-1: Контакт; ManufacturerPartNumber: PBS-1-2.54; Specification: K; BCPId: *; Manufacturer: *; Rem: *; Package: *; TU/GOST: *; Type: Вилка; HelpURL: *; Price: *
XS1 XS4 = PLS-2: 2 Straight pin 1 3.5mm 1x2P Green Board Edge/Receptacle-Close Plugin,P=3.5mm Pluggable System Terminal Block ROHS; Manufacturer: Ningbo Kangnex Elec; Symbol: Connector; LCPN: C192777; Value: WJ15EDGVC-3.5-2P; URL: https://www.lcsc.com/product-detail/Pluggable-System-Terminal-Block_Ningbo-Kangnex-Elec-WJ15EDGVC-3-5-2P_C192777.html; Type: Connectors; Supplier: LC; MFPN: WJ15EDGVC-3.5-2P; Footprint Type: DIP
XS2 = PLS-10 GBT: Manufacturer: Confly; Symbol: Connector; MFPN: CWF-8R; Value: CWF-10R; URL: *; Type: Connectors; Supplier: LC; Footprint: CWF-8; Footprint Type: DIP
XS3 XS6 = PLS-4_1: Plugin,P=3.5mm Pluggable System Terminal Block ROHS; Manufacturer: Ningbo Kangnex Elec; Symbol: Connector; MFPN: WJ15EDGVC-3.5-4P; LCPN: C5241856; URL: https://www.lcsc.com/product-detail/Pluggable-System-Terminal-Block_Ningbo-Kangnex-Elec-WJ15EDGVC-3-5-4P_C5241856.html; Type: Connectors; Supplier: LC; Footprint Type: DIP; Footprint: 15EDGRC-3.5-4P-Vert N3D
  XS3: Value: CWF-4
  XS6: Value: 5 RGB 500-1000mcd
XS5 = PLS-4_1: Plugin,P=3.5mm Pluggable System Terminal Block ROHS; Manufacturer: Ningbo Kangnex Elec; Symbol: Connector; LCPN: C5241856; URL: https://www.lcsc.com/product-detail/Pluggable-System-Terminal-Block_Ningbo-Kangnex-Elec-WJ15EDGVC-3-5-4P_C5241856.html; Type: Connectors; Supplier: LC; MFPN: WJ15EDGVC-3.5-4P; Footprint Type: DIP; Footprint: 15EDGRC-3.5-4P-Vert N3D; Value: WJ15EDGVC-3.5-4P
XS*1 = PLS-6
ZQ1 = XTAL: 8MHz 20pF ±20ppm HC-49S Crystals ROHS; Manufacturer: Yangxing Tech; MFPN: X49SD8MSD2SC; LCPN: C21263; Type: Crystals; Symbol: Crystal; URL: https://www.lcsc.com/product-detail/Crystals_Yangxing-Tech-X49SD8MSD2SC_C21263.html; Value: HC-49S; Supplier: LC; Footprint Type: Dip; Footprint: HC49-U